# EAGLE design radio (EAGLE 8.1.0)
REVISION: v2.1; TEAM: Robocup SSL
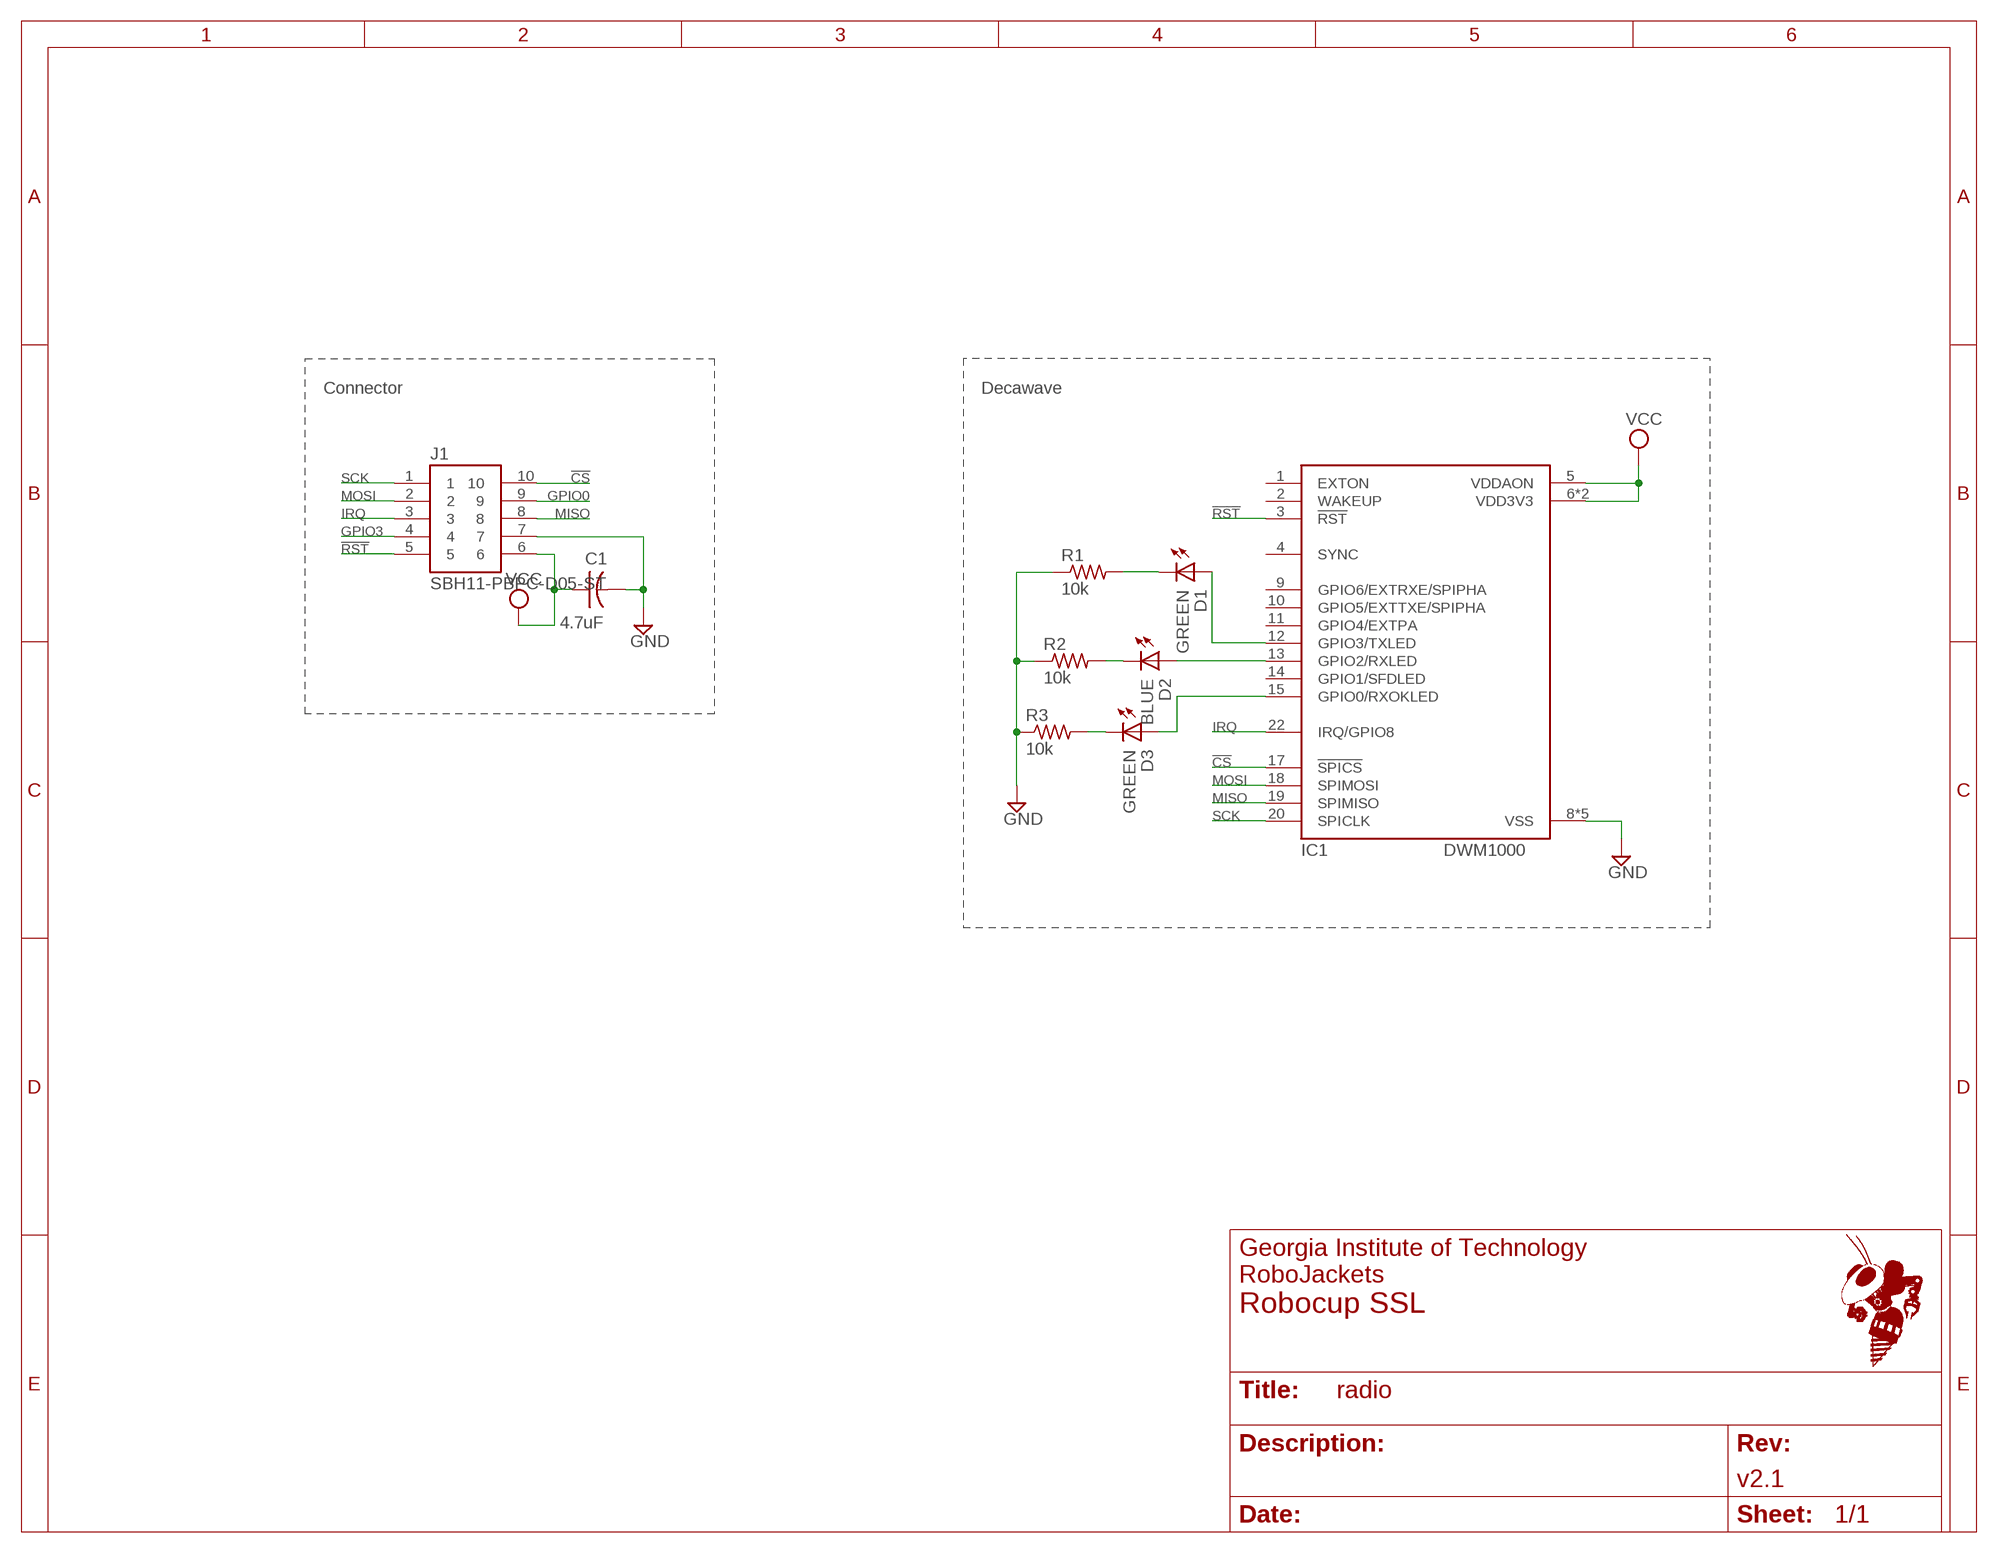
[diagram p0: schematic, sheet 1]
FRAME1 (FRAME_A_L): SCH_DESC: Decawave Radio

## Parts
C1  4.7uF  C-USC0603  [C0603]
D1  GREEN  LED-SMD-GREEN  [CHIP-LED0603]
D2  BLUE  LED-SMD-BLUE  [CHIP-LED0603]
D3  GREEN  LED-SMD-GREEN  [CHIP-LED0603]
IC1  DWM1000  [DWM1000]
J1  SBH11-PBPC-D05-ST  [SFH11-*-D05-ST]
R1  10k  R-US_R0603  [R0603]
R2  10k  R-US_R0603  [R0603]
R3  10k  R-US_R0603  [R0603]

## Nets
!CS: IC1.17(!SPICS) J1.10
!RST: IC1.3(!RST) J1.5
GND: C1.2 IC1.8(VSS) IC1.16(VSS) IC1.21(VSS) IC1.23(VSS) IC1.24(VSS) J1.7 R1.1 R2.1 R3.1
GPIO0: J1.9
GPIO3: J1.4
IRQ: IC1.22(IRQ/GPIO8) J1.3
LED-RX: D2.A IC1.13(GPIO2/RXLED)
LED-RX-PRE: D2.C(K) R2.2
LED-RXOK: D3.A IC1.15(GPIO0/RXOKLED)
LED-RXOK-PRE: D3.C(K) R3.2
LED-TX: D1.A IC1.12(GPIO3/TXLED)
LED-TX-PRE: D1.C(K) R1.2
MISO: IC1.19(SPIMISO) J1.8
MOSI: IC1.18(SPIMOSI) J1.2
SCK: IC1.20(SPICLK) J1.1
VCC: C1.1 IC1.5(VDDAON) IC1.6(VDD3V3) IC1.7(VDD3V3) J1.6
Unconnected: IC1.1(EXTON) IC1.2(WAKEUP) IC1.4(SYNC) IC1.9(GPIO6/EXTRXE/SPIPHA) IC1.10(GPIO5/EXTTXE/SPIPHA) IC1.11(GPIO4/EXTPA) IC1.14(GPIO1/SFDLED)

## Notes on the sheet
- Connector | Decawave

## Library data of the parts
C1 = resistor:C-US: CAPACITOR, American symbol
D1 D3 = RoboJackets-LEDs:LED-SMD; DIGIKEY: 160-1446-1-ND; MPN: LTST-C191KGKT
D2 = RoboJackets-LEDs:LED-SMD; DIGIKEY: 160-1647-1-ND; MPN: LTST-C191TBKT
IC1 = RoboJackets-RF:DWM1000
J1 = RoboJackets-Connectors:SBH11-*-D05-?; DIGIKEY: S9194-ND; MPN: SFH11-PBPC-D05-ST-BK
R1-R3 = rcl:R-US_: RESISTOR, American symbol

## Board
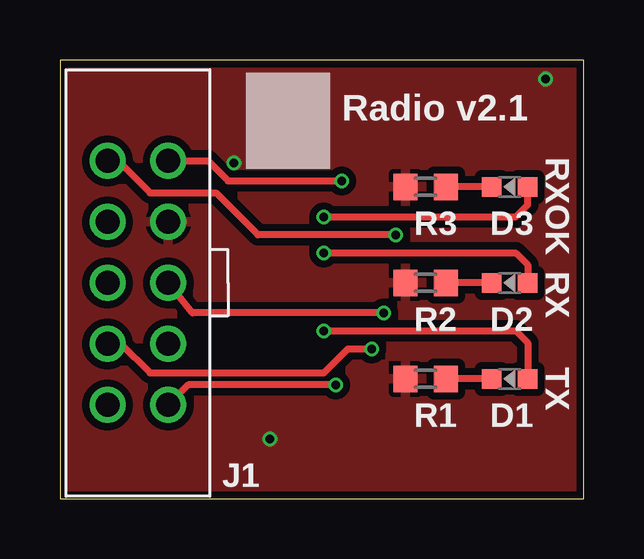
[diagram p1: board, top side]
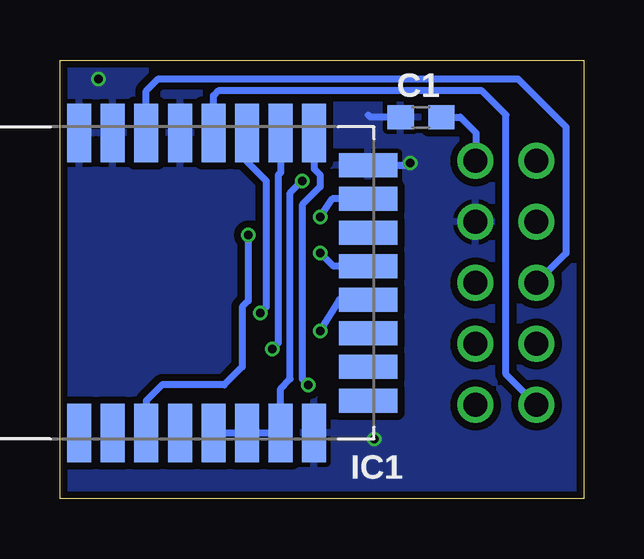
[diagram p2: board, bottom side, seen from below]

Size 21.85 x 18.29 mm. Coordinates in mm from the lower left corner, seen from the top.
Outline: 0,0 21.85,0 21.85,18.29 0,18.29 0,0
Copper layers (1*16): Top 0.018mm / dielectric 1.55mm / Bottom 0.018mm
Design rules "eC_2Layer_PClass6_BaseCopperO18_eCDefault *": minimum track width 0.15mm, minimum drill 0.35mm, track to track 0.2mm, track to pad 0.2mm, pad to pad 0.15mm, via to via 0.15mm, smd to smd 0mil, copper to edge 0.25mm, drill to drill 0.35mm, minimum pad ring 0.175mm, minimum via ring 0.125mm, stop-mask expansion 0mil, vias tented up to drill 0.45mm, thermal gap 0.2mm

### Footprints (pad centres in the part's own frame; a part is rotated, then mirrored left to right if it is on the bottom)
C0603 = smd 1.1 x 1: 1 -0.85,0; 2 0.85,0
CHIP-LED0603 = smd 0.8 x 0.8: A 0,-0.75; C 0,0.75
DWM1000 = smd 2.45 x 1: 1 -6.25,0.8; 2 -6.25,-0.6; 3 -6.25,-2; 4 -6.25,-3.4; 5 -6.25,-4.8; 6 -6.25,-6.2; 7 -6.25,-7.6; 8 -6.25,-9; 17 6.25,-9; 18 6.25,-7.6; 19 6.25,-6.2; 20 6.25,-4.8; 21 6.25,-3.4; 22 6.25,-2; 23 6.25,-0.6; 24 6.25,0.8 | smd 1 x 2.45: 9 -4.9,-11.25; 10 -3.5,-11.25; 11 -2.1,-11.25; 12 -0.7,-11.25; 13 0.7,-11.25; 14 2.1,-11.25; 15 3.5,-11.25; 16 4.9,-11.25
SFH11-*-D05-ST = drill 1: 1 -5.08,1.27; 2 -2.54,1.27; 3 0,1.27; 4 2.54,1.27; 5 5.08,1.27; 6 5.08,-1.27; 7 2.54,-1.27; 8 0,-1.27; 9 -2.54,-1.27; 10 -5.08,-1.27
R0603 = smd 1 x 1.1: 1 -0.85,0; 2 0.85,0

### Placement (x,y rotation side)
C1  6.79,15.91 180 bottom
D1  18.75,5 90 top
D2  18.75,9 90 top
D3  18.75,13 90 top
IC1  20.25,9 90 bottom
J1  3.25,9 90 top
R1  15.25,5 0 top
R2  15.25,9 0 top
R3  15.25,13 0 top

### Tracks (layer width: path | path; a pad name or v marks a point on that pad's centre or on a via)
!CS  (via drill 0.35)
  Top 0.3: v11.5,4.75 5.35,4.75 J1.10
  Bottom 0.3: IC1.17 11.25,13.75 11,13.5 11,13 11.75,12.25 11.75,5 v11.5,4.75
!RST  (via drill 0.35)
  Top 0.3: v14,11 8.25,11 6.5,12.75 3.75,12.75 2.42,14.08 J1.5
  Bottom 0.3: IC1.3 18.25,4.1 17.6,4.75 15,4.75 14.25,5.5 14.25,8 14,8.25 v14,11
GND  (via drill 0.35)
  Bottom 0.3: IC1.16 7.35,13.9 v7.25,14 | C1.2 8.9,15.9 9,16
  other vias: 8.75,2.5 20.25,17.5
  pour Top (isolate 0.3): 0,0 21.85,0 21.85,18.29 0,18.29
  pour Bottom (isolate 0.3): 0,0 21.85,0 21.85,18.29 0,18.29
IRQ
  Bottom 0.3: IC1.22 18.25,17 17.75,17.5 2.75,17.5 0.75,15.5 0.75,10.23 J1.3
LED-RX  (via drill 0.35)
  Top 0.3: v11,10.25 19,10.25 19.5,9.75 D2.A
  Bottom 0.3: IC1.13 10.45,9.7 v11,10.25
LED-RX-PRE
  Top 0.3: D2.C R2.2
LED-RXOK  (via drill 0.35)
  Top 0.3: D3.A 19.5,12.25 19,11.75 v11,11.75
  Bottom 0.3: IC1.15 10.5,12.5 v11,11.75
LED-RXOK-PRE
  Top 0.3: D3.C R3.2
LED-TX  (via drill 0.35)
  Top 0.3: v11,7 19,7 19.5,6.5 D1.A
  Bottom 0.3: IC1.12 10.2,8.3 v11,7
LED-TX-PRE
  Top 0.3: D1.C R1.2
MISO  (via drill 0.35)
  Top 0.3: v13.5,7.75 5.52,7.75 J1.8
  Bottom 0.3: IC1.19 14.05,14.05 13.25,13.25 13.25,8 v13.5,7.75
MOSI  (via drill 0.35)
  Top 0.3: v13,6.25 12,6.25 11,5.25 3.75,5.25 2.54,6.46 J1.2
  Bottom 0.3: IC1.18 12.65,13.6 12.75,13.5 12.75,6.5 v13,6.25
SCK
  Bottom 0.3: IC1.20 15.45,16.8 15.25,17 4.25,17 3.25,16 3.25,5.19 J1.1
VCC  (via drill 0.35)
  Top 0.3: J1.6 6.17,14.08 7,13.25 v11.75,13.25
  Bottom 0.3: IC1.5 IC1.6 IC1.7 12.65,4.6 12.25,5 12.25,12.75 v11.75,13.25 | C1.1 5.16,15.9 4.5,15.25 4.5,14.1 J1.6

### Text on the board
tPlace: Radio v2.1 | RXOK | RX | TX